# Altium schematic sheet Power Distribution.SchDoc
size A; SheetNumber: 1; SheetTotal: 3
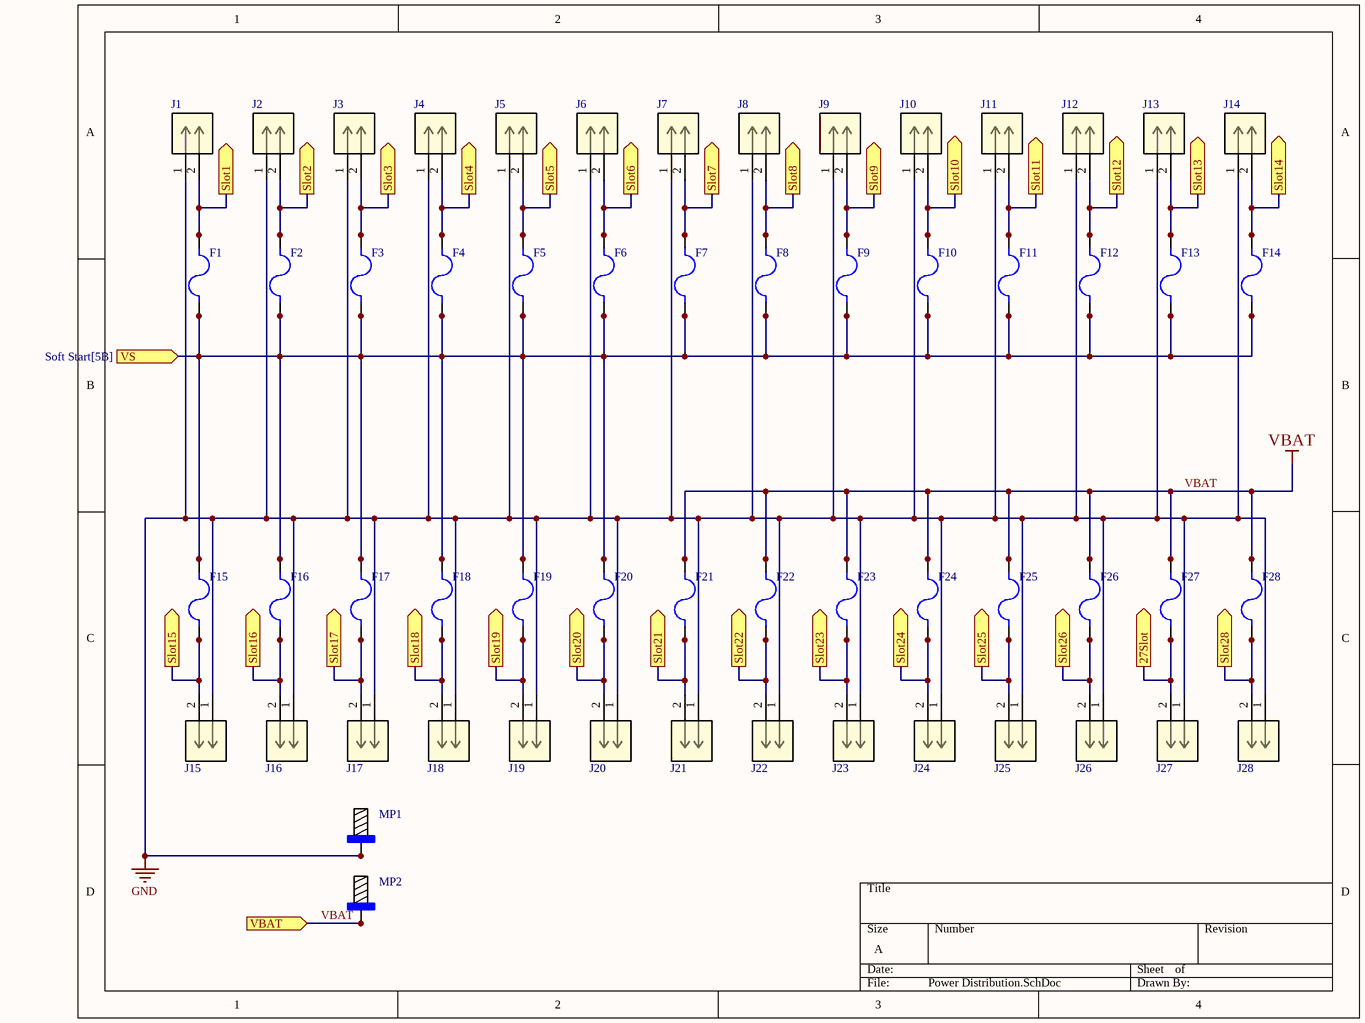
[diagram p0: Power Distribution.SchDoc]

## Parts
F1  36-3557-2-ND  [CONN_3557-2_KEY]  (value not drawn)
F2  36-3557-2-ND  [CONN_3557-2_KEY]  (value not drawn)
F3  36-3557-2-ND  [CONN_3557-2_KEY]  (value not drawn)
F4  36-3557-2-ND  [CONN_3557-2_KEY]  (value not drawn)
F5  36-3557-2-ND  [CONN_3557-2_KEY]  (value not drawn)
F6  36-3557-2-ND  [CONN_3557-2_KEY]  (value not drawn)
F7  36-3557-2-ND  [CONN_3557-2_KEY]  (value not drawn)
F8  36-3557-2-ND  [CONN_3557-2_KEY]  (value not drawn)
F9  36-3557-2-ND  [CONN_3557-2_KEY]  (value not drawn)
F10  36-3557-2-ND  [CONN_3557-2_KEY]  (value not drawn)
F11  36-3557-2-ND  [CONN_3557-2_KEY]  (value not drawn)
F12  36-3557-2-ND  [CONN_3557-2_KEY]  (value not drawn)
F13  36-3557-2-ND  [CONN_3557-2_KEY]  (value not drawn)
F14  36-3557-2-ND  [CONN_3557-2_KEY]  (value not drawn)
F15  36-3557-2-ND  [CONN_3557-2_KEY]  (value not drawn)
F16  36-3557-2-ND  [CONN_3557-2_KEY]  (value not drawn)
F17  36-3557-2-ND  [CONN_3557-2_KEY]  (value not drawn)
F18  36-3557-2-ND  [CONN_3557-2_KEY]  (value not drawn)
F19  36-3557-2-ND  [CONN_3557-2_KEY]  (value not drawn)
F20  36-3557-2-ND  [CONN_3557-2_KEY]  (value not drawn)
F21  36-3557-2-ND  [CONN_3557-2_KEY]  (value not drawn)
F22  36-3557-2-ND  [CONN_3557-2_KEY]  (value not drawn)
F23  36-3557-2-ND  [CONN_3557-2_KEY]  (value not drawn)
F24  36-3557-2-ND  [CONN_3557-2_KEY]  (value not drawn)
F25  36-3557-2-ND  [CONN_3557-2_KEY]  (value not drawn)
F26  36-3557-2-ND  [CONN_3557-2_KEY]  (value not drawn)
F27  36-3557-2-ND  [CONN_3557-2_KEY]  (value not drawn)
F28  36-3557-2-ND  [CONN_3557-2_KEY]  (value not drawn)
J1  CONN MF+ 2 PIN VERT  [CONN_2068320000-SD_02_MOL]  (value not drawn)
J2  CONN MF+ 2 PIN VERT  [CONN_2068320000-SD_02_MOL]  (value not drawn)
J3  CONN MF+ 2 PIN VERT  [CONN_2068320000-SD_02_MOL]  (value not drawn)
J4  CONN MF+ 2 PIN VERT  [CONN_2068320000-SD_02_MOL]  (value not drawn)
J5  CONN MF+ 2 PIN VERT  [CONN_2068320000-SD_02_MOL]  (value not drawn)
J6  CONN MF+ 2 PIN VERT  [CONN_2068320000-SD_02_MOL]  (value not drawn)
J7  CONN MF+ 2 PIN VERT  [CONN_2068320000-SD_02_MOL]  (value not drawn)
J8  CONN MF+ 2 PIN VERT  [CONN_2068320000-SD_02_MOL]  (value not drawn)
J9  CONN MF+ 2 PIN VERT  [CONN_2068320000-SD_02_MOL]  (value not drawn)
J10  CONN MF+ 2 PIN VERT  [CONN_2068320000-SD_02_MOL]  (value not drawn)
J11  CONN MF+ 2 PIN VERT  [CONN_2068320000-SD_02_MOL]  (value not drawn)
J12  CONN MF+ 2 PIN VERT  [CONN_2068320000-SD_02_MOL]  (value not drawn)
J13  CONN MF+ 2 PIN VERT  [CONN_2068320000-SD_02_MOL]  (value not drawn)
J14  CONN MF+ 2 PIN VERT  [CONN_2068320000-SD_02_MOL]  (value not drawn)
J15  CONN MF+ 2 PIN VERT  [CONN_2068320000-SD_02_MOL]  (value not drawn)
J16  CONN MF+ 2 PIN VERT  [CONN_2068320000-SD_02_MOL]  (value not drawn)
J17  CONN MF+ 2 PIN VERT  [CONN_2068320000-SD_02_MOL]  (value not drawn)
J18  CONN MF+ 2 PIN VERT  [CONN_2068320000-SD_02_MOL]  (value not drawn)
J19  CONN MF+ 2 PIN VERT  [CONN_2068320000-SD_02_MOL]  (value not drawn)
J20  CONN MF+ 2 PIN VERT  [CONN_2068320000-SD_02_MOL]  (value not drawn)
J21  CONN MF+ 2 PIN VERT  [CONN_2068320000-SD_02_MOL]  (value not drawn)
J22  CONN MF+ 2 PIN VERT  [CONN_2068320000-SD_02_MOL]  (value not drawn)
J23  CONN MF+ 2 PIN VERT  [CONN_2068320000-SD_02_MOL]  (value not drawn)
J24  CONN MF+ 2 PIN VERT  [CONN_2068320000-SD_02_MOL]  (value not drawn)
J25  CONN MF+ 2 PIN VERT  [CONN_2068320000-SD_02_MOL]  (value not drawn)
J26  CONN MF+ 2 PIN VERT  [CONN_2068320000-SD_02_MOL]  (value not drawn)
J27  CONN MF+ 2 PIN VERT  [CONN_2068320000-SD_02_MOL]  (value not drawn)
J28  CONN MF+ 2 PIN VERT  [CONN_2068320000-SD_02_MOL]  (value not drawn)
MP1  732-3278-ND  [*WP-SHFU_7461098_HAL]  (value not drawn)
MP2  732-3278-ND  [*WP-SHFU_7461098_HAL]  (value not drawn)

## Ports
27Slot (out, see Status LEDs[4B]), Slot1 (out, see Status LEDs[1A]), Slot2 (out, see Status LEDs[1A]), Slot3 (out, see Status LEDs[1A]), Slot4 (out, see Status LEDs[2A]), Slot5 (out, see Status LEDs[2A]), Slot6 (out, see Status LEDs[2A]), Slot7 (out, see Status LEDs[2A]), Slot8 (out, see Status LEDs[3A]), Slot9 (out, see Status LEDs[3A]), Slot10 (out, see Status LEDs[3A]), Slot11 (out, see Status LEDs[3A]), Slot12 (out, see Status LEDs[4A]), Slot13 (out, see Status LEDs[4A]), Slot14 (out, see Status LEDs[4A]), Slot15 (out, see Status LEDs[1B]), Slot16 (out, see Status LEDs[1B]), Slot17 (out, see Status LEDs[1B]), Slot18 (out, see Status LEDs[2B]), Slot19 (out, see Status LEDs[2B]), Slot20 (out, see Status LEDs[2B]), Slot21 (out, see Status LEDs[2B]), Slot22 (out, see Status LEDs[3B]), Slot23 (out, see Status LEDs[3B]), Slot24 (out, see Status LEDs[3B]), Slot25 (out, see Status LEDs[3B]), Slot26 (out, see Status LEDs[4B]), Slot28 (out, see Status LEDs[4B]), VBAT (in), VS (in, see Soft Start[5B])

## Nets
GND: J1.1 J2.1 J3.1 J4.1 J5.1 J6.1 J7.1 J8.1 J9.1 J10.1 J11.1 J12.1 J13.1 J14.1 J15.1 J16.1 J17.1 J18.1 J19.1 J20.1 J21.1 J22.1 J23.1 J24.1 J25.1 J26.1 J27.1 J28.1 MP1.1 MP1.2 MP1.3 MP1.4 MP1.5 MP1.6 MP1.7 MP1.8 MP1.9 MP1.10 MP1.11 MP1.12 MP1.13 MP1.14 MP1.15 MP1.16 MP1.17 MP1.18 MP1.19 MP1.20 MP1.21 MP1.22 MP1.23 MP1.24 MP1.25
VBAT: F21.1_1 F21.1_2 F22.1_1 F22.1_2 F23.1_1 F23.1_2 F24.1_1 F24.1_2 F25.1_1 F25.1_2 F26.1_1 F26.1_2 F27.1_1 F27.1_2 F28.1_1 F28.1_2 MP2.1 MP2.2 MP2.3 MP2.4 MP2.5 MP2.6 MP2.7 MP2.8 MP2.9 MP2.10 MP2.11 MP2.12 MP2.13 MP2.14 MP2.15 MP2.16 MP2.17 MP2.18 MP2.19 MP2.20 MP2.21 MP2.22 MP2.23 MP2.24 MP2.25 ; port VBAT
27Slot: F27.2_1 F27.2_2 J27.2 ; port 27Slot
Slot1: F1.1_1 F1.1_2 J1.2 ; port Slot1
Slot2: F2.1_1 F2.1_2 J2.2 ; port Slot2
Slot3: F3.1_1 F3.1_2 J3.2 ; port Slot3
Slot4: F4.1_1 F4.1_2 J4.2 ; port Slot4
Slot5: F5.1_1 F5.1_2 J5.2 ; port Slot5
Slot6: F6.1_1 F6.1_2 J6.2 ; port Slot6
Slot7: F7.1_1 F7.1_2 J7.2 ; port Slot7
Slot8: F8.1_1 F8.1_2 J8.2 ; port Slot8
Slot9: F9.1_1 F9.1_2 J9.2 ; port Slot9
Slot10: F10.1_1 F10.1_2 J10.2 ; port Slot10
Slot11: F11.1_1 F11.1_2 J11.2 ; port Slot11
Slot12: F12.1_1 F12.1_2 J12.2 ; port Slot12
Slot13: F13.1_1 F13.1_2 J13.2 ; port Slot13
Slot14: F14.1_1 F14.1_2 J14.2 ; port Slot14
Slot15: F15.2_1 F15.2_2 J15.2 ; port Slot15
Slot16: F16.2_1 F16.2_2 J16.2 ; port Slot16
Slot17: F17.2_1 F17.2_2 J17.2 ; port Slot17
Slot18: F18.2_1 F18.2_2 J18.2 ; port Slot18
Slot19: F19.2_1 F19.2_2 J19.2 ; port Slot19
Slot20: F20.2_1 F20.2_2 J20.2 ; port Slot20
Slot21: F21.2_1 F21.2_2 J21.2 ; port Slot21
Slot22: F22.2_1 F22.2_2 J22.2 ; port Slot22
Slot23: F23.2_1 F23.2_2 J23.2 ; port Slot23
Slot24: F24.2_1 F24.2_2 J24.2 ; port Slot24
Slot25: F25.2_1 F25.2_2 J25.2 ; port Slot25
Slot26: F26.2_1 F26.2_2 J26.2 ; port Slot26
Slot28: F28.2_1 F28.2_2 J28.2 ; port Slot28
VS: F1.2_1 F1.2_2 F2.2_1 F2.2_2 F3.2_1 F3.2_2 F4.2_1 F4.2_2 F5.2_1 F5.2_2 F6.2_1 F6.2_2 F7.2_1 F7.2_2 F8.2_1 F8.2_2 F9.2_1 F9.2_2 F10.2_1 F10.2_2 F11.2_1 F11.2_2 F12.2_1 F12.2_2 F13.2_1 F13.2_2 F14.2_1 F14.2_2 F15.1_1 F15.1_2 F16.1_1 F16.1_2 F17.1_1 F17.1_2 F18.1_1 F18.1_2 F19.1_1 F19.1_2 F20.1_1 F20.1_2 ; port VS

## Library data of the parts
F1-F28 = FUSE-0002: Fuse Block 30 A 500V 1 Circuit Blade Through Hole / MINI ATO FUSE; MF: Keystone Electronics; MP: 3557-2; Package: Nonstandard Keystone; Check_prices: https://www.snapeda.com/parts/3557-2/Keystone+Electronics/view-part/?ref=eda; Value: *; Purchase-URL: https://pricing.snapeda.com/search/part/3557-2/?ref=eda; Availability: In Stock; SnapEDA_Link: https://www.snapeda.com/parts/3557-2/Keystone+Electronics/view-part/?ref=snap; Price: None
J1-J28 = CONN MF+ 2 PIN VERT: Micro-Fit+ Vertical Header, Through Hole, 3.00mm Pitch, Dual Row, 2 Circuits, Tin (Sn) Plating, Glow-Wire Capable, Black, Tray; Manufacturer_Name: Molex Connector Corporation; Manufacturer_Part_Number: 2068320201; Copyright: Copyright (C) 2025 Ultra Librarian. All rights reserved.; RefDes: RefDes; Type: Type
MP1 MP2 = CONN-1POS-0002: 25 Pin Shank Terminal M6 Through Hole; MF: WÃ¼rth Elektronik; MP: 7461098; Package: None; Price: None; SnapEDA_Link: https://www.snapeda.com/parts/7461098/W%25C3%25BCrth+Elektronik+Midcom/view-part/?ref=snap; Availability: Unavailable; Check_prices: https://www.snapeda.com/parts/7461098/W%25C3%25BCrth+Elektronik+Midcom/view-part/?ref=eda; Value: *